# Altium schematic sheet INPUTS_GATES.SchDoc
size A4; SheetNumber: 1; SheetTotal: 12
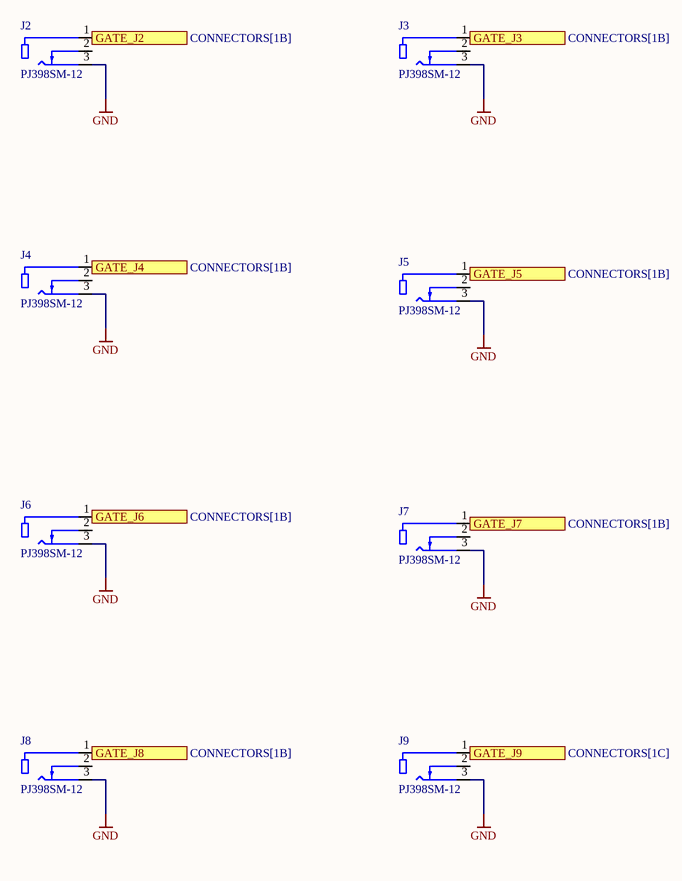
[diagram p0: INPUTS_GATES.SchDoc]

## Parts
J2  PJ398SM-12  [THONK_PJ398SM-12]
J3  PJ398SM-12  [THONK_PJ398SM-12]
J4  PJ398SM-12  [THONK_PJ398SM-12]
J5  PJ398SM-12  [THONK_PJ398SM-12]
J6  PJ398SM-12  [THONK_PJ398SM-12]
J7  PJ398SM-12  [THONK_PJ398SM-12]
J8  PJ398SM-12  [THONK_PJ398SM-12]
J9  PJ398SM-12  [THONK_PJ398SM-12]

## Ports
GATE_J2 (see CONNECTORS[1B]), GATE_J3 (see CONNECTORS[1B]), GATE_J4 (see CONNECTORS[1B]), GATE_J5 (see CONNECTORS[1B]), GATE_J6 (see CONNECTORS[1B]), GATE_J7 (see CONNECTORS[1B]), GATE_J8 (see CONNECTORS[1B]), GATE_J9 (see CONNECTORS[1C])

## Nets
GND: J2.3 J3.3 J4.3 J5.3 J6.3 J7.3 J8.3 J9.3
GATE_J2: J2.1 ; port GATE_J2
GATE_J3: J3.1 ; port GATE_J3
GATE_J4: J4.1 ; port GATE_J4
GATE_J5: J5.1 ; port GATE_J5
GATE_J6: J6.1 ; port GATE_J6
GATE_J7: J7.1 ; port GATE_J7
GATE_J8: J8.1 ; port GATE_J8
GATE_J9: J9.1 ; port GATE_J9

Not connected (* = marked no-connect by the designer): J2 2; J3 2; J4 2; J5 2; J6 2; J7 2; J8 2; J9 2

## Library data of the parts
J2-J9 = PJ398SM-12: 3.5mm Switching Jack Socket; MF: Thonk; Availability: Not in stock; Price: None; Package: Package; MP: PJ398SM-12; Value: *